# Altium schematic sheet Processor_Interface.SchDoc: Processor 40pin GPIO Interface
size A; Engineer: D Board; DocumentNumber: 1; Revision: 1.2c; SheetNumber: 1
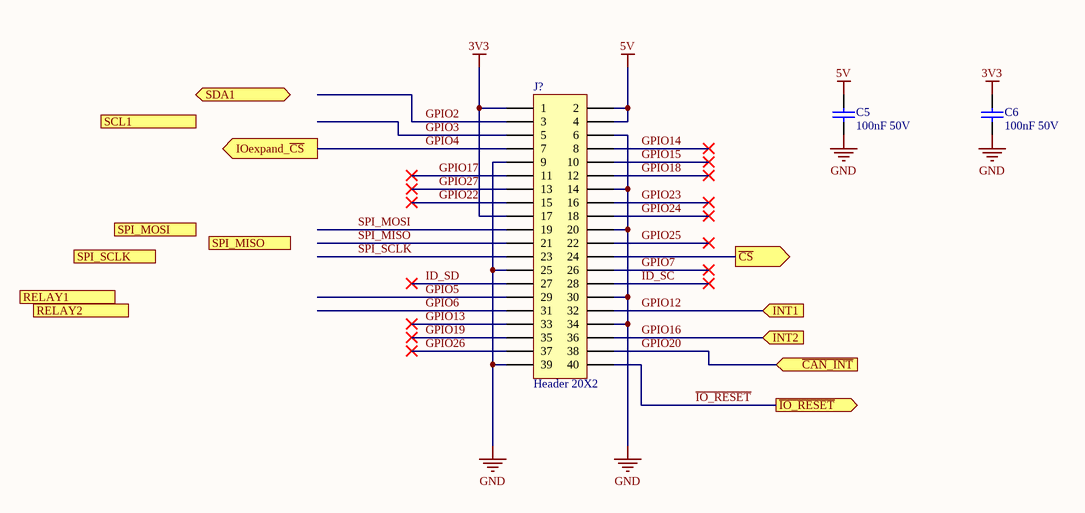
[diagram p0: Processor_Interface.SchDoc]

## Parts
C5  100nF 50V  [0603C_L]
C6  100nF 50V  [0603C_L]
J?  Header 20X2  [HDR2X20]

## Ports
INT1 (in), INT2 (in), IOexpand_~{CS} (out), RELAY1 (out), RELAY2 (out), SCL1 (out), SDA1 (bidir), SPI_MISO (in), SPI_MOSI (out), SPI_SCLK (out), ~{CAN_INT} (in), ~{CS} (out), ~{IO_RESET} (out)

## Nets
3V3: C6.2 J?.1 J?.17
5V: C5.2 J?.2 J?.4
GND: C5.1 C6.1 J?.6 J?.9 J?.14 J?.20 J?.25 J?.30 J?.34 J?.39
~{IO_RESET}: J?.40 ; port ~{IO_RESET}
~{CS}: J?.24 ; port ~{CS}
GPIO2: J?.3
GPIO3: J?.5
GPIO4: J?.7 ; port IOexpand_~{CS}
GPIO5: J?.29
GPIO6: J?.31
GPIO7: J?.26
GPIO12: J?.32 ; port INT1
GPIO13: J?.33
GPIO14: J?.8
GPIO15: J?.10
GPIO16: J?.36 ; port INT2
GPIO17: J?.11
GPIO18: J?.12
GPIO19: J?.35
GPIO20: J?.38 ; port ~{CAN_INT}
GPIO22: J?.15
GPIO23: J?.16
GPIO24: J?.18
GPIO25: J?.22
GPIO26: J?.37
GPIO27: J?.13
ID_SC: J?.28
ID_SD: J?.27
SPI_MISO: J?.21
SPI_MOSI: J?.19
SPI_SCLK: J?.23

## Notes on the sheet
- Title
- Size:
- Date:
- A
- Project:
- Time:
- Revision:
- Sheet
- of
- Engineer:
- File:

## Library data of the parts
C5 C6 = Cap100nF_50V_0603: Manufacturer: Yageo; Manufacturer Part Number: CC0603ZRY5V9BB104; Capacitance: 0.10µF; Tolerance: -20%, +80%; Temperature Coefficient: Y5V (F); Supplier 1: Digi-Key; Supplier Part Number 1: 311-1343-1-ND; RoHS: RoHS Compliant; Category: Capacitors; Stock 1: 1827128; Pricing 1: 1=0.1, 10=0.018, 25=0.0128, 100=0.0082, 250=0.00672, 500=0.00574, 1000=0.00447 (USD); Packaging: Cut Tape (CT); Part Status: Active; Voltage - Rated: 50V; Operating Temperature: -30°C ~ 85°C; Features: -; Ratings: -; Applications: General Purpose; Failure Rate: -; Mounting Type: Surface Mount, MLCC; Package / Case: 0603 (1608 Metric); Size / Dimension: 0.063" L x 0.031" W (1.60mm x 0.80mm); Height - Seated (Max): -; Thickness (Max): 0.035" (0.90mm); Lead Spacing: -; Lead Style: -; ComponentLink1URL: http://www.yageo.com/documents/recent/UPY-GPHC_Y5V_6.3V-to-50V_6.pdf; ComponentLink1Description: http://www.yageo.com/documents/recent/UPY-GPHC_Y5V_6.3V-to-50V_6.pdf
J? = Header 20X2: Header, 20-Pin, Dual row; LatestRevisionDate: 17-Jul-2002; LatestRevisionNote: Re-released for DXP Platform.; Publisher: Altium Limited